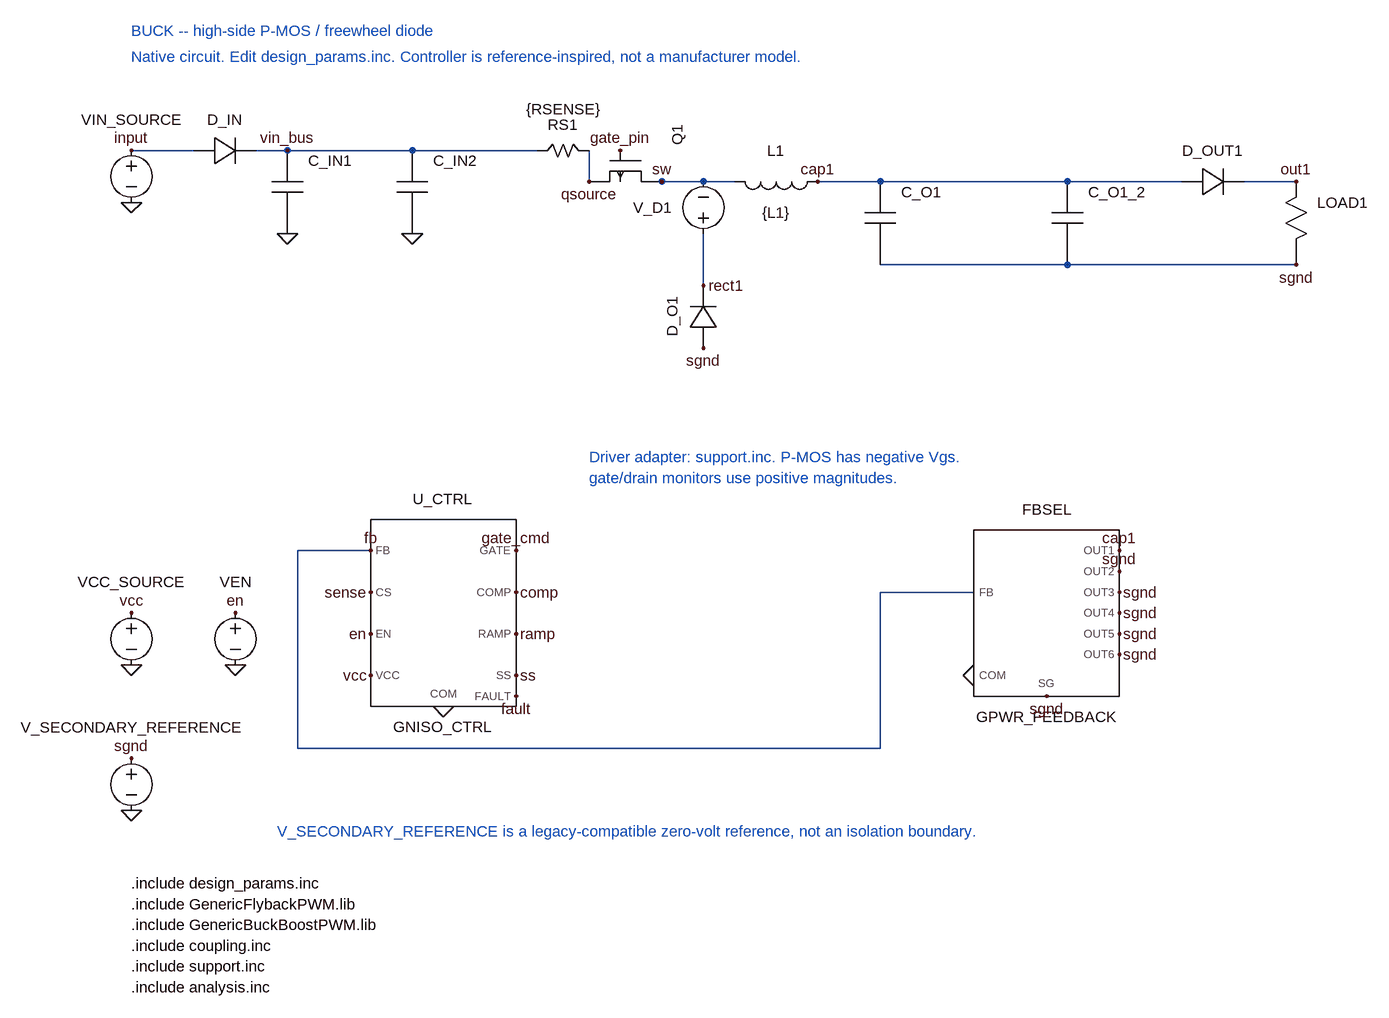
[diagram p0: schematic Buck.asc]
Buck.asc, the LTspice schematic file:
Version 4
SHEET 1 880 680
WIRE 64 200 160 200
WIRE 256 200 304 200
WIRE 304 200 496 200
WIRE 496 200 688 200
WIRE 768 200 768 248
WIRE 880 248 992 248
WIRE 944 408 944 328
WIRE 944 248 880 248
WIRE 1120 248 1216 248
WIRE 1216 248 1504 248
WIRE 1504 248 1680 248
WIRE 1776 248 1856 248
WIRE 1216 376 1504 376
WIRE 1504 376 1856 376
WIRE 1360 880 1216 880
WIRE 1216 880 1216 1120
WIRE 1216 1120 320 1120
WIRE 320 1120 320 816
WIRE 320 816 432 816
FLAG 64 200 input
FLAG 64 280 0
FLAG 304 200 vin_bus
FLAG 304 328 0
FLAG 496 328 0
FLAG 768 248 qsource
FLAG 880 248 sw
FLAG 816 200 gate_pin
FLAG 944 504 sgnd
FLAG 944 408 rect1
FLAG 1120 248 cap1
FLAG 1856 248 out1
FLAG 1856 376 sgnd
FLAG 432 816 fb
FLAG 432 880 sense
FLAG 432 944 en
FLAG 432 1008 vcc
FLAG 544 1056 0
FLAG 656 816 gate_cmd
FLAG 656 880 comp
FLAG 656 944 ramp
FLAG 656 1008 ss
FLAG 656 1040 fault
FLAG 1584 816 cap1
FLAG 1584 848 sgnd
FLAG 1584 880 sgnd
FLAG 1584 912 sgnd
FLAG 1584 944 sgnd
FLAG 1584 976 sgnd
FLAG 1472 1040 sgnd
FLAG 1360 1008 0
FLAG 64 912 vcc
FLAG 64 992 0
FLAG 224 912 en
FLAG 224 992 0
FLAG 64 1136 sgnd
FLAG 64 1216 0
SYMBOL PowerVoltage 64 184 R0
SYMATTR InstName VIN_SOURCE
SYMATTR Value {VIN}
SYMBOL PowerDiode 160 200 R0
SYMATTR InstName D_IN
SYMATTR Value GPWR_DIODE
SYMATTR SpiceLine VF={D_IN_VF} ACT={D_IN_EN} CJ={DIODE_CJ}
SYMBOL PowerCap 288 200 R0
SYMATTR InstName C_IN1
SYMATTR Value GPWR_CAP
SYMATTR SpiceLine C={C_IN1_C} ESR={C_IN1_ESR} ESL={C_IN1_ESL} ACT={C_IN1_EN}
SYMBOL PowerCap 480 200 R0
SYMATTR InstName C_IN2
SYMATTR Value GPWR_CAP
SYMATTR SpiceLine C={C_IN2_C} ESR={C_IN2_ESR} ESL={C_IN2_ESL} ACT={C_IN2_EN}
SYMBOL NisoHres 688 200 R0
SYMATTR InstName RS1
SYMATTR Value {RSENSE}
SYMBOL NisoPmos 880 200 R90
SYMATTR InstName Q1
SYMATTR Value GNISO_PMOS
SYMATTR SpiceLine RON={Q_RON} COSS={Q_COSS} CG={Q_CG} VG={VG} CJ={DIODE_CJ}
SYMBOL PowerChoke 992 248 R0
SYMATTR InstName L1
SYMATTR Value {L1}
SYMATTR SpiceLine Rser={RL1}
SYMBOL PowerDiode 944 504 R270
SYMATTR InstName D_O1
SYMATTR Value GPWR_DIODE
SYMATTR SpiceLine VF={D_O1_VF} ACT={D_O1_EN} CJ={DIODE_CJ}
SYMBOL NisoProbe 944 344 R180
SYMATTR InstName V_D1
SYMATTR Value 0
SYMBOL PowerCap 1200 248 R0
SYMATTR InstName C_O1
SYMATTR Value GPWR_CAP
SYMATTR SpiceLine C={C_O1_C} ESR={C_O1_ESR} ESL={C_O1_ESL} ACT={C_O1_EN}
SYMBOL PowerCap 1488 248 R0
SYMATTR InstName C_O1_2
SYMATTR Value GPWR_CAP
SYMATTR SpiceLine C={C_O1_2_C} ESR={C_O1_2_ESR} ESL={C_O1_2_ESL} ACT={C_O1_2_EN}
SYMBOL PowerDiode 1680 248 R0
SYMATTR InstName D_OUT1
SYMATTR Value GPWR_DIODE
SYMATTR SpiceLine VF={D_OUT1_VF} ACT={D_OUT1_EN} CJ={DIODE_CJ}
SYMBOL PowerLoad 1840 248 R0
SYMATTR InstName LOAD1
SYMATTR Value I=V(out1,sgnd)/{RLOAD1}*(1+({LOAD_AFTER}-1)*limit((time-{TLOAD})/1e-6,0,1))
SYMBOL NisoController 544 912 R0
SYMATTR InstName U_CTRL
SYMATTR Value GNISO_CTRL
SYMATTR SpiceLine FSW={FSW} MODE={MODE} DMAX={DMAX} VM={VM} A_CS={A_CS} SLOPE={SLOPE} CS_LIM={CS_LIM} TBLANK={TBLANK} TONMIN={TONMIN} TPROP={TPROP} VG={VG} RDRV={RDRV} UVLO={UVLO} VSET={VSET} TSS={TSS} TYPE={TYPE} KP={KP} FZ1={FZ1} FP1={FP1} FZ2={FZ2} FP2={FP2} CMAX={CMAX} TEN={TEN} SSMODE={SSMODE} SSFRAC={SSFRAC} COFF={COFF} SSCLO={SSCLO} SSCHI={SSCHI} SCMODE={SCMODE} SCP={SCP} SCPBLANK={SCPBLANK} OLPEN={OLPEN} TOLP={TOLP} THOLD={THOLD} TOFF={TOFF} CS_TAU={CS_TAU} LIMIT_RAMP={LIMIT_RAMP}
SYMBOL FeedbackSelector 1472 912 R0
SYMATTR InstName FBSEL
SYMATTR Value GPWR_FEEDBACK
SYMATTR SpiceLine SEL={FB_SELECT} H={FB_SCALE}
SYMBOL PowerVoltage 64 896 R0
SYMATTR InstName VCC_SOURCE
SYMATTR Value {VG}
SYMBOL PowerVoltage 224 896 R0
SYMATTR InstName VEN
SYMATTR Value PULSE(0 1 1e-6 10e-9 10e-9 {2*TSTOP} {3*TSTOP})
SYMBOL PowerVoltage 64 1120 R0
SYMATTR InstName V_SECONDARY_REFERENCE
SYMATTR Value 0
TEXT 64 16 Left 2 ;BUCK -- high-side P-MOS / freewheel diode
TEXT 64 56 Left 2 ;Native circuit. Edit design_params.inc. Controller is reference-inspired, not a manufacturer model.
TEXT 768 672 Left 2 ;Driver adapter: support.inc. P-MOS has negative Vgs.
TEXT 768 704 Left 2 ;gate/drain monitors use positive magnitudes.
TEXT 288 1248 Left 2 ;V_SECONDARY_REFERENCE is a legacy-compatible zero-volt reference, not an isolation boundary.
TEXT 64 1328 Left 2 !.include design_params.inc
TEXT 64 1360 Left 2 !.include GenericFlybackPWM.lib
TEXT 64 1392 Left 2 !.include GenericBuckBoostPWM.lib
TEXT 64 1424 Left 2 !.include coupling.inc
TEXT 64 1456 Left 2 !.include support.inc
TEXT 64 1488 Left 2 !.include analysis.inc

The netlist it stands for:
* Buck.asc
VIN_SOURCE input 0 {VIN}
XD_IN input vin_bus GPWR_DIODE VF={D_IN_VF} ACT={D_IN_EN} CJ={DIODE_CJ}  ; pins A K
XC_IN1 vin_bus 0 GPWR_CAP C={C_IN1_C} ESR={C_IN1_ESR} ESL={C_IN1_ESL} ACT={C_IN1_EN}  ; pins P N
XC_IN2 vin_bus 0 GPWR_CAP C={C_IN2_C} ESR={C_IN2_ESR} ESL={C_IN2_ESL} ACT={C_IN2_EN}  ; pins P N
RS1 vin_bus qsource {RSENSE}
XQ1 sw gate_pin qsource GNISO_PMOS RON={Q_RON} COSS={Q_COSS} CG={Q_CG} VG={VG} CJ={DIODE_CJ}  ; pins D G S
L1 sw cap1 {L1} Rser={RL1}
XD_O1 sgnd rect1 GPWR_DIODE VF={D_O1_VF} ACT={D_O1_EN} CJ={DIODE_CJ}  ; pins A K
V_D1 rect1 sw 0
XC_O1 cap1 sgnd GPWR_CAP C={C_O1_C} ESR={C_O1_ESR} ESL={C_O1_ESL} ACT={C_O1_EN}  ; pins P N
XC_O1_2 cap1 sgnd GPWR_CAP C={C_O1_2_C} ESR={C_O1_2_ESR} ESL={C_O1_2_ESL} ACT={C_O1_2_EN}  ; pins P N
XD_OUT1 cap1 out1 GPWR_DIODE VF={D_OUT1_VF} ACT={D_OUT1_EN} CJ={DIODE_CJ}  ; pins A K
B§LOAD1 out1 sgnd I=V(out1,sgnd)/{RLOAD1}*(1+({LOAD_AFTER}-1)*limit((time-{TLOAD})/1e-6,0,1))
XU_CTRL fb sense en vcc gate_cmd comp ramp ss fault 0 GNISO_CTRL FSW={FSW} MODE={MODE} DMAX={DMAX} VM={VM} A_CS={A_CS} SLOPE={SLOPE} CS_LIM={CS_LIM} TBLANK={TBLANK} TONMIN={TONMIN} TPROP={TPROP} VG={VG} RDRV={RDRV} UVLO={UVLO} VSET={VSET} TSS={TSS} TYPE={TYPE} KP={KP} FZ1={FZ1} FP1={FP1} FZ2={FZ2} FP2={FP2} CMAX={CMAX} TEN={TEN} SSMODE={SSMODE} SSFRAC={SSFRAC} COFF={COFF} SSCLO={SSCLO} SSCHI={SSCHI} SCMODE={SCMODE} SCP={SCP} SCPBLANK={SCPBLANK} OLPEN={OLPEN} TOLP={TOLP} THOLD={THOLD} TOFF={TOFF} CS_TAU={CS_TAU} LIMIT_RAMP={LIMIT_RAMP}  ; pins FB CS EN VCC GATE COMP RAMP SS FAULT COM
XFBSEL cap1 sgnd sgnd sgnd sgnd sgnd sgnd fb 0 GPWR_FEEDBACK SEL={FB_SELECT} H={FB_SCALE}  ; pins OUT1 OUT2 OUT3 OUT4 OUT5 OUT6 SG FB COM
VCC_SOURCE vcc 0 {VG}
VEN en 0 PULSE(0 1 1e-6 10e-9 10e-9 {2*TSTOP} {3*TSTOP})
V_SECONDARY_REFERENCE sgnd 0 0
* BUCK -- high-side P-MOS / freewheel diode
* Native circuit. Edit design_params.inc. Controller is reference-inspired, not a manufacturer model.
* Driver adapter: support.inc. P-MOS has negative Vgs.
* gate/drain monitors use positive magnitudes.
* V_SECONDARY_REFERENCE is a legacy-compatible zero-volt reference, not an isolation boundary.
.include design_params.inc
.include GenericFlybackPWM.lib
.include GenericBuckBoostPWM.lib
.include coupling.inc
.include support.inc
.include analysis.inc
.lib GenericFlybackPWM.lib
.lib GenericBuckBoostPWM.lib
.backanno
.end